# Altium schematic sheet pwr.SchDoc
size OrCAD A; SheetNumber: 2; SheetTotal: 5
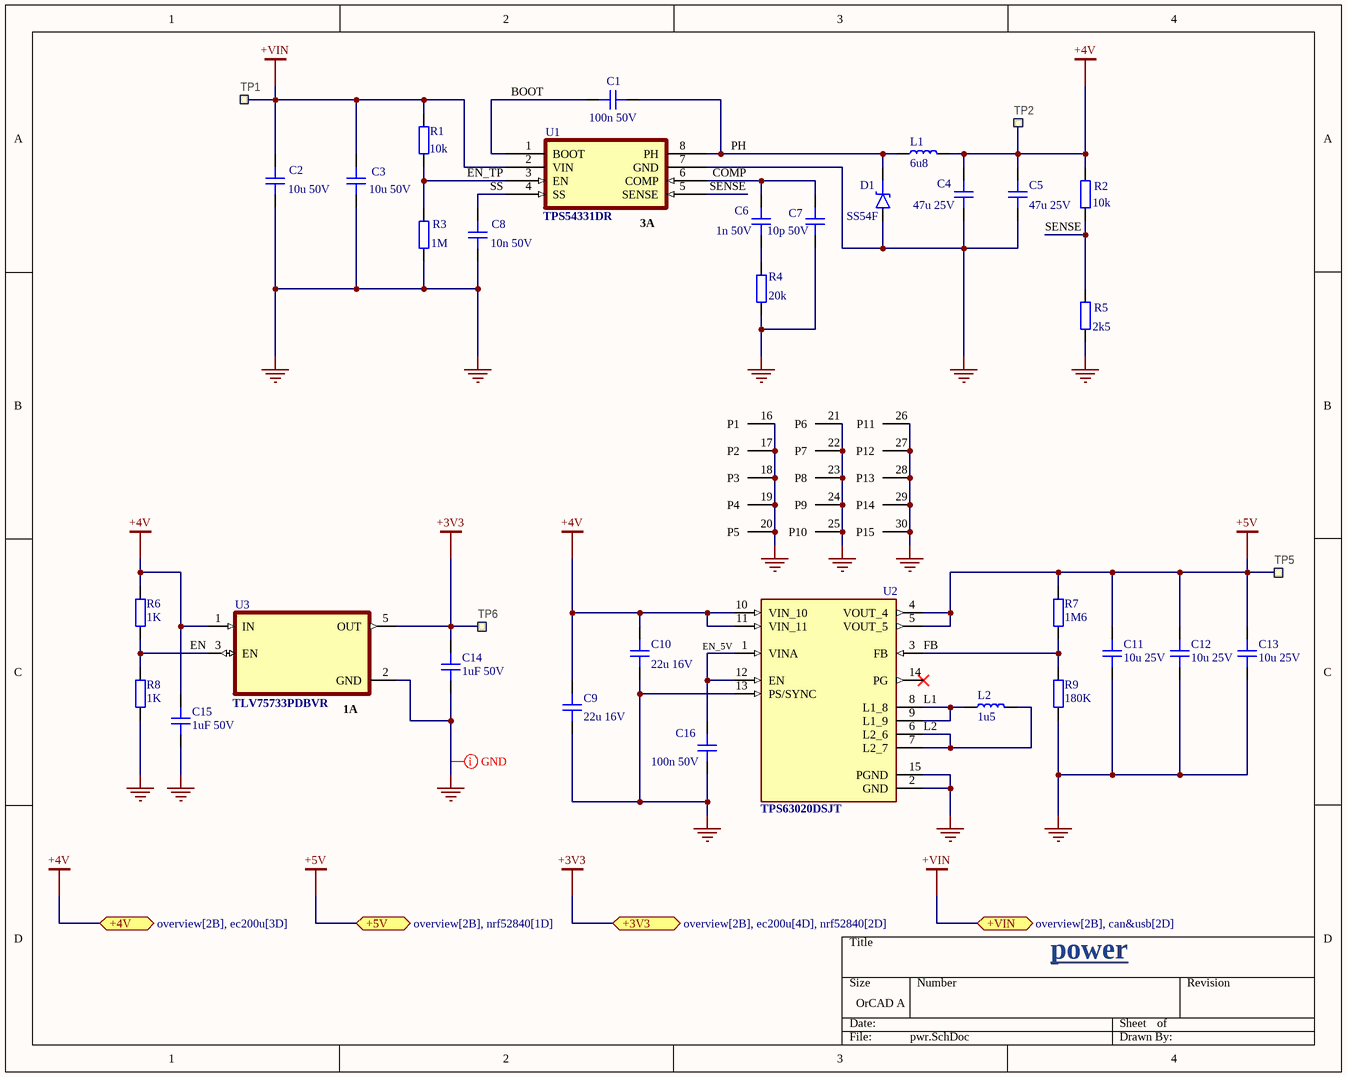
[diagram p0: pwr.SchDoc]

## Parts
C1  100n 50V  [CAP_0402]
C2  10u 50V  [CAP_1206]
C3  10u 50V  [CAP_1206]
C4  47u 25V  [CAP_1206]
C5  47u 25V  [CAP_1206]
C6  1n 50V  [CAP_0603]
C7  10p 50V  [CAP_0402]
C8  10n 50V  [CAP_0603]
C9  22u 16V  [CAP_0603]
C10  22u 16V  [CAP_0603]
C11  10u 25V  [CAP_0603]
C12  10u 25V  [CAP_0603]
C13  10u 25V  [CAP_0603]
C14  1uF 50V  [CAP_0603]
C15  1uF 50V  [CAP_0603]
C16  100n 50V  [CAP_0402]
D1  SS54F  [DIOM5226X100N]
L1  6u8  [ASPI-0630HI-6R8M-T15]
L2  1u5  [IND_1008]
R1  10k  [RES_0603]
R2  10k  [RES_0603]
R3  1M  [RES_0603]
R4  20k  [RES_0603]
R5  2k5  [RES_0603]
R6  1K  [RES_0603]
R7  1M6  [RES_0805]
R8  1K  [RES_0603]
R9  180K  [RES_0805]
TP1  Ø1.0mm,SMD  [TP_SMD_D1.0mm]  (value not drawn)  (no BOM)
TP2  Ø1.0mm,SMD  [TP_SMD_D1.0mm]  (value not drawn)  (no BOM)
TP5  Ø1.0mm,SMD  [TP_SMD_D1.0mm]  (value not drawn)  (no BOM)
TP6  Ø1.0mm,SMD  [TP_SMD_D1.0mm]  (value not drawn)  (no BOM)
U1  TPS54331DR  [SOIC127P599X175-8N]
U2  TPS63020DSJT  [IC_TPS63020DSJT]
U3  TLV75733PDBVR  [SOT95P280X145-5N]

## Ports
+3V3 (bidir, see overview[2B], ec200u[4D], nrf52840[2D]), +4V (bidir, see overview[2B], ec200u[3D]), +5V (bidir, see overview[2B], nrf52840[1D]), +VIN (bidir, see overview[2B], can&usb[2D])

## Nets
+3V3: C14.2 TP6.1 U3.5(OUT) ; port +3V3
+4V: C4.2 C5.2 C9.2 C10.2 C15.2 L1.2 R2.2 R6.2 TP2.1 U2.10(VIN_10) U2.11(VIN_11) U3.1(IN) ; port +4V
+5V: C11.2 C12.2 C13.2 R7.1 TP5.1 U2.4(VOUT_4) U2.5(VOUT_5) ; port +5V
+VIN: C2.2 C3.2 R1.2 TP1.1 U1.2(VIN) ; port +VIN
GND: C2.1 C3.1 C4.1 C5.1 C7.1 C8.1 C9.1 C10.1 C11.1 C12.1 C13.1 C14.1 C15.1 C16.1 D1.A R3.1 R4.1 R5.1 R8.1 R9.2 U1.7(GND) U2.2(GND) U2.13(PS/SYNC) U2.15(PGND) U2.16(P1) U2.17(P2) U2.18(P3) U2.19(P4) U2.20(P5) U2.21(P6) U2.22(P7) U2.23(P8) U2.24(P9) U2.25(P10) U2.26(P11) U2.27(P12) U2.28(P13) U2.29(P14) U2.30(P15) U3.2(GND)
BOOT: C1.2 U1.1(BOOT)
COMP: C6.2 C7.2 U1.6(COMP)
EN: R6.1 R8.2 U3.3(EN)
EN_5V: C16.2 U2.1(VINA) U2.12(EN)
EN_TP: R1.1 R3.2 U1.3(EN)
FB: R7.2 R9.1 U2.3(FB)
L1: L2.1 U2.8(L1_8) U2.9(L1_9)
L2: L2.2 U2.6(L2_6) U2.7(L2_7)
PH: C1.1 D1.K L1.1 U1.8(PH)
SENSE: R2.1 R5.2 U1.5(SENSE)
SS: C8.2 U1.4(SS)
NetC6_1: C6.1 R4.2

Not connected (* = marked no-connect by the designer): U2 14(PG)*

## Layout directives
rule Width Constraint [Pref Width = 0.5mm    Min Width = 0.2mm    Max Width = 0.5mm]; net class GND: GND

## Notes on the sheet
- (near U1) 3A
- (near U3) 1A
- power

## Library data of the parts
C1 C16 = CAP_0402: Capacitor SMD 0402; Manufacturer: Murata Electronics; MPN: GRM155R71H104KE14D; Distributor Link: *; LCSC NO: C77020; Rating: *; Dielectric: *; ComponentLink1Description: LCSC Link; ComponentLink1URL: https://lcsc.com/product-detail/Multilayer-Ceramic-Capacitors-MLCC-SMD-SMT_Murata-Electronics-GRM155R71H104KE14D_C77020.html?s_z=n_100nF
C2-C5 = CAP_1206: Capacitor SMD 1206; Manufacturer: *; Manufacturer Part Number: *; Distributor Link: *; LCSC: *; Rating: *; Dielectric: *
C6 C8-C15 = CAP_0603: Capacitor SMD 0603; Manufacturer: *; Manufacturer Part Number: *; Distributor Link: *; LCSC: *; Rating: *; Dielectric: *
C7 = CAP_0402: Capacitor SMD 0402; Manufacturer: *; Manufacturer Part Number: *; Distributor Link: *; LCSC: *; Rating: *; Dielectric: *
D1 = Schottky Diode_3: Schottky Diode SMD SMAF package
L1 = ASPI-0630HI-6R8M-T15: Inductor SMD 6.8uH 20% 8A Shielded; Manufacturer: ABRACON; Manufacturer Part Number: ASPI-0630HI-6R8M-T15
L2 = IND_1008: Inductor SMD 1008
R1-R6 R8 = RES_0603: Resistor SMD 0603; Manufacturer: *; Manufacturer Part Number: *; Distributor Link: *; LCSC: *
R7 R9 = RES_0805: Resistor SMD 0805; Manufacturer: *; Manufacturer Part Number: *; Distributor Link: *; LCSC: *
TP1 TP2 TP5 TP6 = TP_SMD_Ø1.0MM: 1.0mm circular SMD testpad; Manufacturer: Nordic Semiconductor; Manufacturer Part Number: N.A.; Part number NEMS: 100500475; Pad Count: 1; Component Status: Active; Part Number: TP_SMD_Ø1.0MM; ComponentLink1URL: N.A.; ComponentLink1Description: Datasheet; ComponentLink2URL: N.A.; ComponentLink2Description: Supplier link; HelpURL: N.A.; Footprint Doc: TP_SMD_Ø1.0mm; LatestRevisionDate: 2021-03-05; Published: 2013-06-11; Value: Ø1.0mm,SMD; Note: N.A.; Artikkelnr Noca: N.A.; Part number IPS: N.A.; Supplier 1: N.A.; Supplier Part Number 1: N.A.; Supplier 2: N.A.; Supplier Part Number 2: N.A.; PartId: 100500475; Component Class: Connectors; Author: rsk; Part number Norautron: N.A.
U2 = TPS63020DSJT: High Efficiency Single Inductor Buck-Boost Converter with 4A Switch; MF: Texas Instruments; SnapEDA_Link: https://www.snapeda.com/parts/TPS63020DSJT/Texas+Instruments/view-part/?ref=snap; Package: VSON-14 Texas Instruments; Value: *; MP: TPS63020DSJT; Check_prices: https://www.snapeda.com/parts/TPS63020DSJT/Texas+Instruments/view-part/?ref=eda
U3 = TLV75733PDBVR: 1-A, low-IQ, high-accuracy, low-dropout voltage regulator with enable; MF: Texas Instruments; Check_prices: https://www.snapeda.com/parts/TLV75733PDBVR/Texas+Instruments/view-part/?ref=eda; Value: *; Availability: In Stock; MP: TLV75733PDBVR; Price: None; Package: SOT-23-5 Texas Instruments; SnapEDA_Link: https://www.snapeda.com/parts/TLV75733PDBVR/Texas+Instruments/view-part/?ref=snap; Purchase-URL: https://pricing.snapeda.com/search/part/TLV75733PDBVR/?ref=eda